# Altium schematic sheet Sheet1.SchDoc
size 381 x 241 mm
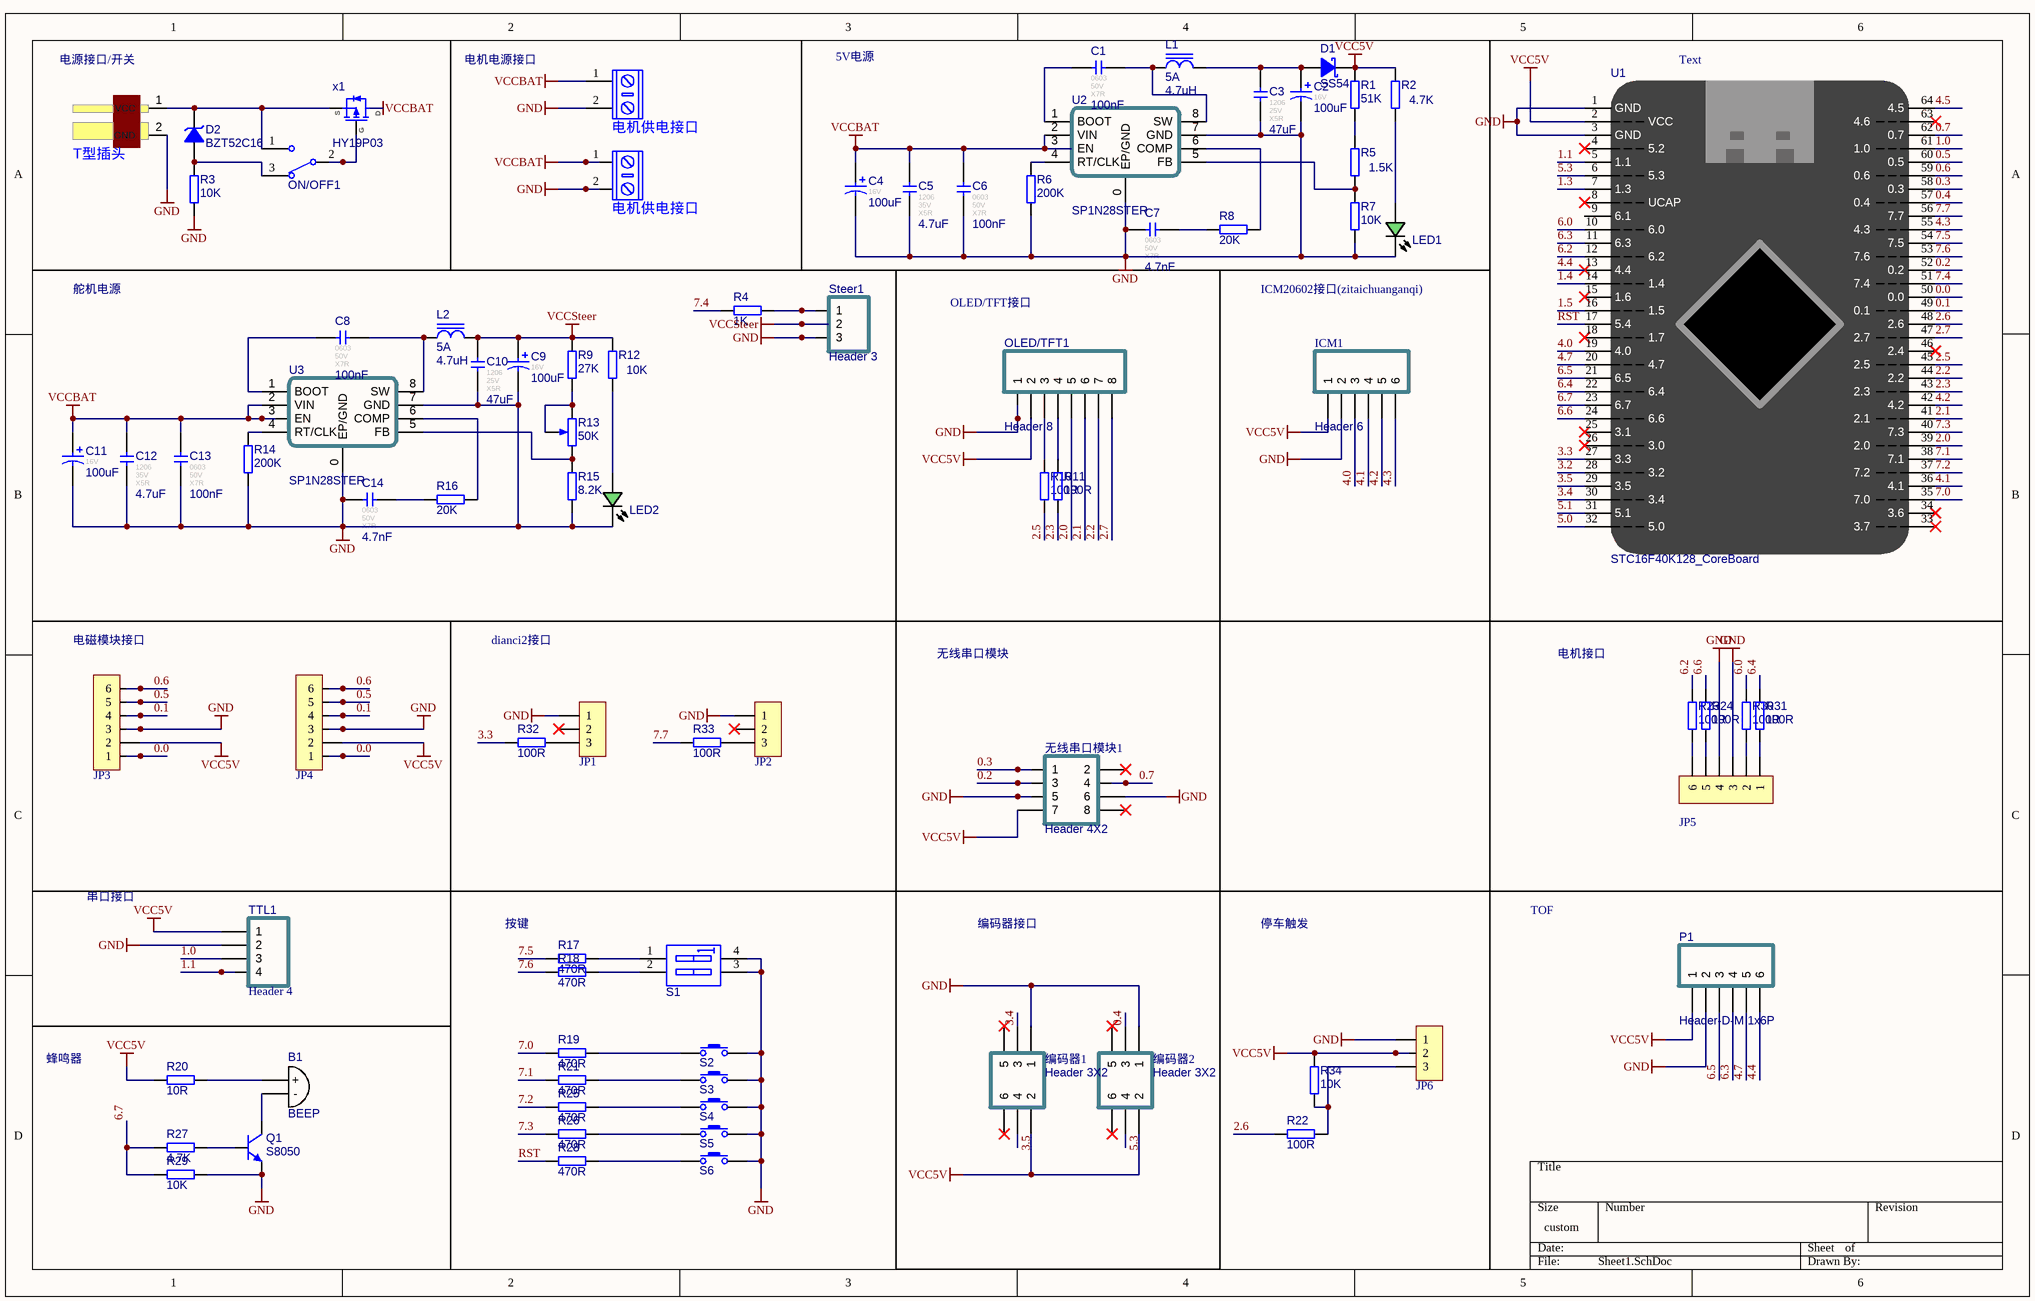
[diagram p0: Sheet1.SchDoc]

## Parts
B1  BEEP  [BEEP 9x5.5mm]
C1  value 100nF  FootPrint: 0603  Voltage: 50V  Type: X7R  [CAPC1608[0603]S-N]  (hidden comment: 100nF 50V X7R)
C2  value 100uF  Voltage: 16V  [CAP-E-S 6.3]  (hidden comment: 100uF 16V 铝电解)
C3  value 47uF  FootPrint: 1206  Voltage: 25V  Type: X5R  [CAPC3216[1206]S]  (hidden comment: 47uF 25V X5R)
C4  value 100uF  Voltage: 16V  [CAP-E-S 6.3]  (hidden comment: 100uF 16V 铝电解)
C5  value 4.7uF  FootPrint: 1206  Voltage: 35V  Type: X5R  [CAPC3216[1206]S]  (hidden comment: 4.7uF 35V X5R)
C6  value 100nF  FootPrint: 0603  Voltage: 50V  Type: X7R  [CAPC1608[0603]S-N]  (hidden comment: 100nF 50V X7R)
C7  value 4.7nF  FootPrint: 0603  Voltage: 50V  Type: X7R  [CAPC1608[0603]S-N]  (hidden comment: 4.7nF 50V X7R)
C8  value 100nF  FootPrint: 0603  Voltage: 50V  Type: X7R  [CAPC1608[0603]S-N]  (hidden comment: 100nF 50V X7R)
C9  value 100uF  Voltage: 16V  [CAP-E-S 6.3]  (hidden comment: 100uF 16V 铝电解)
C10  value 47uF  FootPrint: 1206  Voltage: 25V  Type: X5R  [CAPC3216[1206]S]  (hidden comment: 47uF 25V X5R)
C11  value 100uF  Voltage: 16V  [CAP-E-S 6.3]  (hidden comment: 100uF 16V 铝电解)
C12  value 4.7uF  FootPrint: 1206  Voltage: 35V  Type: X5R  [CAPC3216[1206]S]  (hidden comment: 4.7uF 35V X5R)
C13  value 100nF  FootPrint: 0603  Voltage: 50V  Type: X7R  [CAPC1608[0603]S-N]  (hidden comment: 100nF 50V X7R)
C14  value 4.7nF  FootPrint: 0603  Voltage: 50V  Type: X7R  [CAPC1608[0603]S-N]  (hidden comment: 4.7nF 50V X7R)
D1  SS54  [SMA-L[DO-214AC]]
D2  BZT52C16  [SOD-123-L]
DCIN1  T型插头  [Wired T-Header ThroughHole]
DCOUT1  电机供电接口  [KF/WJ/DG 301-2p-5.0mm]
DCOUT2  电机供电接口  [KF/WJ/DG 301-2p-5.0mm]
ICM1  Header 6  [HDR1X6]
JP1  HDR-1X3  [GH1.25-LT-3P]  (value not drawn)
JP2  HDR-1X3  [GH1.25-LT-3P]  (value not drawn)
JP3  HDR-1X6  [MX1.25-W-6P]  (value not drawn)
JP4  HDR-1X6  [MX1.25-W-6P]  (value not drawn)
JP5  HDR-1X6  [MX1.25-W-6P]  (value not drawn)
JP6  HDR-1X3  [GH1.25-LT-3P]  (value not drawn)
L1  value 4.7uH  Imax: 5A  [0630 TPC 7*7*3]  (hidden comment: 4.7uH 5A)
L2  value 4.7uH  Imax: 5A  [0630 TPC 7*7*3]  (hidden comment: 4.7uH 5A)
LED1  翠绿贴片LED  [LEDC1608(0603)-L]  (value not drawn)
LED2  翠绿贴片LED  [LEDC1608(0603)-L]  (value not drawn)
OLED/TFT1  Header 8  [HDR1X8]
ON/OFF1  SW-SPDT  [SS12D10]  (value not drawn)
P1  Header-D-M 1x6P  [HDR1X6-M]
Q1  S8050  [SOT-23]
R1  value 51K  [RESC1608[0603]S-N]  (hidden comment: 51K ±1%)
R2  value 4.7K  [RESC1608[0603]S-N]  (hidden comment: 4.7K ±1%)
R3  value 10K  [RESC1608[0603]S-N]  (hidden comment: 10K ±1%)
R4  value 1K  [RESC1608[0603]S-N]  (hidden comment: 1K ±1%)
R5  value 1.5K  [RESC1608[0603]S-N]  (hidden comment: 1.5K ±1%)
R6  value 200K  [RESC1608[0603]S-N]  (hidden comment: 200K ±1%)
R7  value 10K  [RESC1608[0603]S-N]  (hidden comment: 10K ±1%)
R8  value 20K  [RESC1608[0603]S-N]  (hidden comment: 20K ±1%)
R9  value 27K  [RESC1608[0603]S-N]  (hidden comment: 27K ±1%)
R10  value 100R  [RESC1608[0603]S-N]  (hidden comment: 100R ±1%)
R11  value 100R  [RESC1608[0603]S-N]  (hidden comment: 100R ±1%)
R12  value 10K  [RESC1608[0603]S-N]  (hidden comment: 10K ±1%)
R13  50K  [RESPOT3296W]
R14  value 200K  [RESC1608[0603]S-N]  (hidden comment: 200K ±1%)
R15  value 8.2K  [RESC1608[0603]S-N]  (hidden comment: 8.2K ±1%)
R16  value 20K  [RESC1608[0603]S-N]  (hidden comment: 20K ±1%)
R17  value 470R  [RESC1608[0603]S-N]  (hidden comment: 470R ±1%)
R18  value 470R  [RESC1608[0603]S-N]  (hidden comment: 470R ±1%)
R19  value 470R  [RESC1608[0603]S-N]  (hidden comment: 470R ±1%)
R20  value 10R  [RESC1608[0603]S-N]  (hidden comment: 10R ±1%)
R21  value 470R  [RESC1608[0603]S-N]  (hidden comment: 470R ±1%)
R22  value 100R  [RESC1608[0603]S-N]  (hidden comment: 100R ±1%)
R23  value 100R  [RESC1608[0603]S-N]  (hidden comment: 100R ±1%)
R24  value 100R  [RESC1608[0603]S-N]  (hidden comment: 100R ±1%)
R25  value 470R  [RESC1608[0603]S-N]  (hidden comment: 470R ±1%)
R26  value 470R  [RESC1608[0603]S-N]  (hidden comment: 470R ±1%)
R27  value 4.7K  [RESC1608[0603]S-N]  (hidden comment: 4.7K ±1%)
R28  value 470R  [RESC1608[0603]S-N]  (hidden comment: 470R ±1%)
R29  value 10K  [RESC1608[0603]S-N]  (hidden comment: 10K ±1%)
R30  value 100R  [RESC1608[0603]S-N]  (hidden comment: 100R ±1%)
R31  value 100R  [RESC1608[0603]S-N]  (hidden comment: 100R ±1%)
R32  value 100R  [RESC1608[0603]S-N]  (hidden comment: 100R ±1%)
R33  value 100R  [RESC1608[0603]S-N]  (hidden comment: 100R ±1%)
R34  value 10K  [RESC1608[0603]S-N]  (hidden comment: 10K ±1%)
S1  SW DIP-2  [DIP4]  (value not drawn)
S2  Button  [PTS810-3*4-CurvePin]  (value not drawn)
S3  Button  [PTS810-3*4-CurvePin]  (value not drawn)
S4  Button  [PTS810-3*4-CurvePin]  (value not drawn)
S5  Button  [PTS810-3*4-CurvePin]  (value not drawn)
S6  Button  [PTS810-3*4-CurvePin]  (value not drawn)
Steer1  Header 3  [HDR1X3]
TTL1  Header 4  [HDR1X4]
U1  STC16F40K128_CoreBoard  [STC16F40K128_CoreBoard]
U2  SP1N28STER  [SOP-8E]
U3  SP1N28STER  [SOP-8E]
x1  HY19P03  [TO-252AA]
无线串口模块1  Header 4X2  [Female-Header-2.54-SMD-8]
编码器1  Header 3X2  [HDR2X3-M-SMT]
编码器2  Header 3X2  [HDR2X3-M-SMT]

## Nets
GND: C2.2 C3.1 C4.2 C5.1 C6.1 C7.1 C9.2 C10.1 C11.2 C12.1 C13.1 C14.1 DCIN1.2(GND) DCOUT1.2 DCOUT2.2 ICM1.2 JP1.1 JP2.1 JP3.3 JP4.3 JP5.3 JP5.4 JP6.1 LED1.C LED2.C OLED/TFT1.1 P1.2 Q1.2(E) R3.1 R6.1 R7.1 R14.1 R15.1 R29.2 S1.3(B2) S1.4(B1) S2.1 S3.1 S4.1 S5.1 S6.1 Steer1.3 TTL1.2 U1.1(GND) U1.3(GND) U2.0(EP/GND) U2.7(GND) U3.0(EP/GND) U3.7(GND) 无线串口模块1.5 无线串口模块1.6 编码器1.1 编码器2.1
VCC5V: D1.K ICM1.1 JP3.2 JP4.2 JP6.2 OLED/TFT1.2 P1.1 R1.2 R2.2 R20.1 R34.2 TTL1.1 U1.2(VCC) 无线串口模块1.7 编码器1.2 编码器2.2
VCCBAT: C4.1 C5.2 C6.2 C11.1 C12.2 C13.2 DCOUT1.1 DCOUT2.1 U2.2(VIN) U2.3(EN) U3.2(VIN) U3.3(EN) x1.1(D)
VCCSteer: C9.1 C10.2 L2.2 R9.2 R12.2 Steer1.2
0.0: JP3.1 JP4.1 U1.50(0.0)
0.1: JP3.4 JP4.4 U1.49(0.1)
0.2: U1.52(0.2) 无线串口模块1.3
0.3: U1.58(0.3) 无线串口模块1.1
0.4: U1.57(0.4) 编码器2.3
0.5: JP3.5 JP4.5 U1.60(0.5)
0.6: JP3.6 JP4.6 U1.59(0.6)
0.7: U1.62(0.7) 无线串口模块1.4
1.0: TTL1.3 U1.61(1.0)
1.1: TTL1.4 U1.5(1.1)
1.3: U1.7(1.3)
1.4: U1.14(1.4)
1.5: U1.16(1.5)
2.0: OLED/TFT1.5 U1.39(2.0)
2.1: OLED/TFT1.6 U1.41(2.1)
2.2: OLED/TFT1.7 U1.44(2.2)
2.3: R11.1 U1.43(2.3)
2.5: R10.1 U1.45(2.5)
2.6: R22.2 U1.48(2.6)
2.7: OLED/TFT1.8 U1.47(2.7)
3.2: U1.28(3.2)
3.3: R32.1 U1.27(3.3)
3.4: U1.30(3.4) 编码器1.3
3.5: U1.29(3.5) 编码器1.4
4.0: ICM1.3 U1.19(4.0)
4.1: ICM1.4 U1.36(4.1)
4.2: ICM1.5 U1.42(4.2)
4.3: ICM1.6 U1.55(4.3)
4.4: P1.6 U1.13(4.4)
4.5: U1.64(4.5)
4.7: P1.5 U1.20(4.7)
5.0: U1.32(5.0)
5.1: U1.31(5.1)
5.3: U1.6(5.3) 编码器2.4
6.0: R30.2 U1.10(6.0)
6.2: R23.2 U1.12(6.2)
6.3: P1.4 U1.11(6.3)
6.4: R31.2 U1.22(6.4)
6.5: P1.3 U1.21(6.5)
6.6: R24.2 U1.24(6.6)
6.7: R27.1 R29.1 U1.23(6.7)
7.0: R19.1 U1.35(7.0)
7.1: R21.1 U1.38(7.1)
7.2: R25.1 U1.37(7.2)
7.3: R26.1 U1.40(7.3)
7.4: R4.1 U1.51(7.4)
7.5: R17.1 U1.54(7.5)
7.6: R18.1 U1.53(7.6)
7.7: R33.1 U1.56(7.7)
RST: R28.1 U1.17(5.4)
NetB1_1: B1.1(+) R20.2
NetB1_2: B1.2(-) Q1.3(C)
NetC1_1: C1.1 U2.1(BOOT)
NetC1_2: C1.2 L1.1 U2.8(SW)
NetC2_1: C2.1 C3.2 D1.A L1.2
NetC7_2: C7.2 R8.1
NetC8_1: C8.1 U3.1(BOOT)
NetC8_2: C8.2 L2.1 U3.8(SW)
NetC14_2: C14.2 R16.1
NetD2_A: D2.A ON/OFF1.3 R3.2
NetD2_K: D2.K DCIN1.1(VCC) ON/OFF1.1 x1.3(S)
NetJP1_3: JP1.3 R32.2
NetJP2_3: JP2.3 R33.2
NetJP5_1: JP5.1 R31.1
NetJP5_2: JP5.2 R30.1
NetJP5_5: JP5.5 R24.1
NetJP5_6: JP5.6 R23.1
NetJP6_3: JP6.3 R22.1 R34.1
NetLED1_A: LED1.A R2.1
NetLED2_A: LED2.A R12.1
NetOLED/TFT1_3: OLED/TFT1.3 R10.2
NetOLED/TFT1_4: OLED/TFT1.4 R11.2
NetON/OFF1_2: ON/OFF1.2 x1.2(G)
NetQ1_1: Q1.1(B) R27.2
NetR1_1: R1.1 R5.2
NetR4_2: R4.2 Steer1.1
NetR5_1: R5.1 R7.2 U2.5(FB)
NetR6_2: R6.2 U2.4(RT/CLK)
NetR8_2: R8.2 U2.6(COMP)
NetR9_1: R9.1 R13.1(TOP) R13.ADJ
NetR13_2: R13.2(BOT) R15.2 U3.5(FB)
NetR14_2: R14.2 U3.4(RT/CLK)
NetR16_2: R16.2 U3.6(COMP)
NetR17_2: R17.2 S1.1(A1)
NetR18_2: R18.2 S1.2(A2)
NetR19_2: R19.2 S2.2
NetR21_2: R21.2 S3.2
NetR25_2: R25.2 S4.2
NetR26_2: R26.2 S5.2
NetR28_2: R28.2 S6.2

Not connected (* = marked no-connect by the designer): JP1 2*; JP2 2*; U1 4(5.2)* 8(UCAP)* 9(6.1) 15(1.6)* 18(1.7)* 25(3.1)* 26(3.0)* 33(3.7)* 34(3.6)* 46(2.4)* 63(4.6)*; 无线串口模块1 2* 8*; 编码器1 5* 6*; 编码器2 5* 6*

## Notes on the sheet
- 电源接口/开关
- 电机电源接口
- 5V电源
- (near U1) Text
- 舵机电源
- OLED/TFT接口
- ICM20602接口(zitaichuanganqi)
- (near JP3) 电磁模块接口
- dianci2接口
- 无线串口模块
- 电机接口
- 串口接口
- TOF
- 按键
- 编码器接口
- 停车触发
- 蜂鸣器

## Library data of the parts
B1 = BEEP: 蜂鸣器
C1 C6 C8 C13 = 100nF 0603 50V X7R: 贴片瓷片电容; MLCC; 0603(1608);; Revision: V1.0
C2 C4 C9 C11 = E-S 220uF 25V 6.3x7.7: 贴片电解电容 100uF 16V 6.3x5.4; Revision: V1.0; Type: 铝电解
C3 C10 = 47uF 1206 25V X5R: 贴片瓷片电容; MLCC; 1206(3216);; Revision: V1.0
C5 C12 = 4.7uF 1206 35V X5R: 贴片瓷片电容; MLCC; 1206(3216);; Revision: V1.0
C7 C14 = 4.7nF 0603 50V X7R: 贴片瓷片电容; MLCC; 0603(1608);; Revision: V1.0
D1 = SS54: SS54 肖特基二极管; Revision: V1.0; Value: SS54
D2 = Diode TVS Uni-Dir: TRANSIENT VOLTAGE  SUPPRESSOR DIODE; Imax: 500mA; Published: 8-Jun-2000; Publisher: Altium Limited; Price(RMB): 0.000
DCIN1 = T_Header
DCOUT1 DCOUT2 = KF/WJ/DG 30x: 接线端子 2Pin
ICM1 = Header 6: Header, 6-Pin; LatestRevisionDate: 17-Jul-2002; LatestRevisionNote: Re-released for DXP Platform.; Publisher: Altium Limited; Price(RMB): 0.00
JP1 JP2 JP6 = Header 3: 3P连接器; 联系卖家 免费技术支持: 封装库来自淘宝卖家ID：黄晶宝石; BOM名称: 3P连接器
JP3-JP5 = Header 6: 6P连接器; 联系卖家 免费技术支持: 封装库来自淘宝卖家ID：黄晶宝石; BOM名称: 6P连接器
L1 L2 = Ind-Power: 功率电感; DCR: .5m; Published: 8-Jun-2000; Revision: July-2002: Re-released for DXP Platform.; Publisher: Altium Limited; Price(RMB): 0.000
LED1 LED2 = LED Chip Green: Published: 8-Jun-2000; Revision: July-2002: Re-released for DXP Platform.; Publisher: Altium Limited; Price(RMB): 0.00
OLED/TFT1 = Header 8: Header, 8-Pin; LatestRevisionDate: 17-Jul-2002; LatestRevisionNote: Re-released for DXP Platform.; Publisher: Altium Limited; Price(RMB): 0.00
ON/OFF1 = SW-SPDT: 单刀双掷开关 3脚船型、钮子、拨动开关 SPDT Subminiature Toggle Switch; Published: 24-Mar-1999; Publisher: Altium Limited; Price(RMB): 0.000
P1 = Header-D-M 1x6P: 1x6pin, 直插, 排针; Revision: V1.0; Value: Header-D-M 1x6P
Q1 = NPN S8050: Discrete NPN Bipolar Transistor; Published: 8-Jun-2000; Revision: July-2002: Re-released for DXP Platform.; Publisher: Altium Limited; Price(RMB): 0.000; PartNumber: S8050
R1 R2 R5 R7 R9 R12 R15 = Res-Chip_7: 贴片电阻; Power: 1/8W; Revision: V1.0; Tolerance: ±1%
R3 R4 = Res-Chip_4: 贴片电阻; Published: 8-Jun-2000; Revision: July-2002: Re-released for DXP Platform.; Publisher: Altium Limited; Price(RMB): 0.000; Tolerance: ±1%
R6 R8 R14 R16 = Res-Chip_1: 贴片电阻; Power: 1/8W; Revision: V1.0; Tolerance: ±1%
R10 R11 R22 = Res-Chip_5: 贴片电阻; Published: 8-Jun-2000; Revision: July-2002: Re-released for DXP Platform.; Publisher: Altium Limited; Price(RMB): 0.000; Tolerance: ±1%
R13 = Res-Adj-3p: 可调电阻; Revision: V1.0; Value: 50K
R17-R19 R21 R25 R26 R28 = Res-Chip_8: 贴片电阻; Published: 8-Jun-2000; Revision: July-2002: Re-released for DXP Platform.; Publisher: Altium Limited; Price(RMB): 0.000; Tolerance: ±1%
R20 = Res-Chip_6: 贴片电阻; Published: 8-Jun-2000; Revision: July-2002: Re-released for DXP Platform.; Publisher: Altium Limited; Price(RMB): 0.000; Tolerance: ±1%
R23 R24 R30-R33 = Res-Chip_9: 贴片电阻; Power: 1/8W; Revision: V1.0; Tolerance: ±1%
R27 = Res-Chip: 贴片电阻; Published: 8-Jun-2000; Revision: July-2002: Re-released for DXP Platform.; Publisher: Altium Limited; Price(RMB): 0.000; Tolerance: ±1%
R29 = Res-Chip_3: 贴片电阻; Published: 8-Jun-2000; Revision: July-2002: Re-released for DXP Platform.; Publisher: Altium Limited; Price(RMB): 0.000; Tolerance: ±1%
R34 = Res-Chip_2: 贴片电阻; Power: 1/8W; Revision: V1.0; Tolerance: ±1%
S1 = Code SW-2: 2位拨码开关; Published: 24-Mar-1999; Revision: July-2002: Re-released for DXP Platform.; Publisher: Altium Limited; Price(RMB): 0.000
S2-S6 = KEY: 按键; Published: 24-Mar-1999; Publisher: Altium Limited; Price(RMB): 0.000
Steer1 = Header 3: Header, 3-Pin; LatestRevisionDate: 17-Jul-2002; LatestRevisionNote: Re-released for DXP Platform.; Publisher: Altium Limited; Price(RMB): 0.00
TTL1 = Header 4: Header, 4-Pin; LatestRevisionDate: 17-Jul-2002; LatestRevisionNote: Re-released for DXP Platform.; Publisher: Altium Limited; Price(RMB): 0.00
U1 = STC16F40K128_CoreBoard: 逐飞科技 STC16F40K128核心板
x1 = HY19P03: HY19P03 P-Channel MOSFET
无线串口模块1 = Header 4X2: Header, 4-Pin, Dual row; LatestRevisionDate: 17-Jul-2002; LatestRevisionNote: Re-released for DXP Platform.; Publisher: Altium Limited; Price(RMB): 0.00
编码器1 编码器2 = Header 3X2: Header, 3-Pin, Dual row; LatestRevisionDate: 17-Jul-2002; LatestRevisionNote: Re-released for DXP Platform.; Publisher: Altium Limited; Price(RMB): 0.00
U2 U3 = SP1N28STER: Revision: V1.0; Value: SP1N28STER